# Altium schematic sheet current sink.SchDoc
size 566 x 495 mm; SheetNumber: 1; SheetTotal: 1
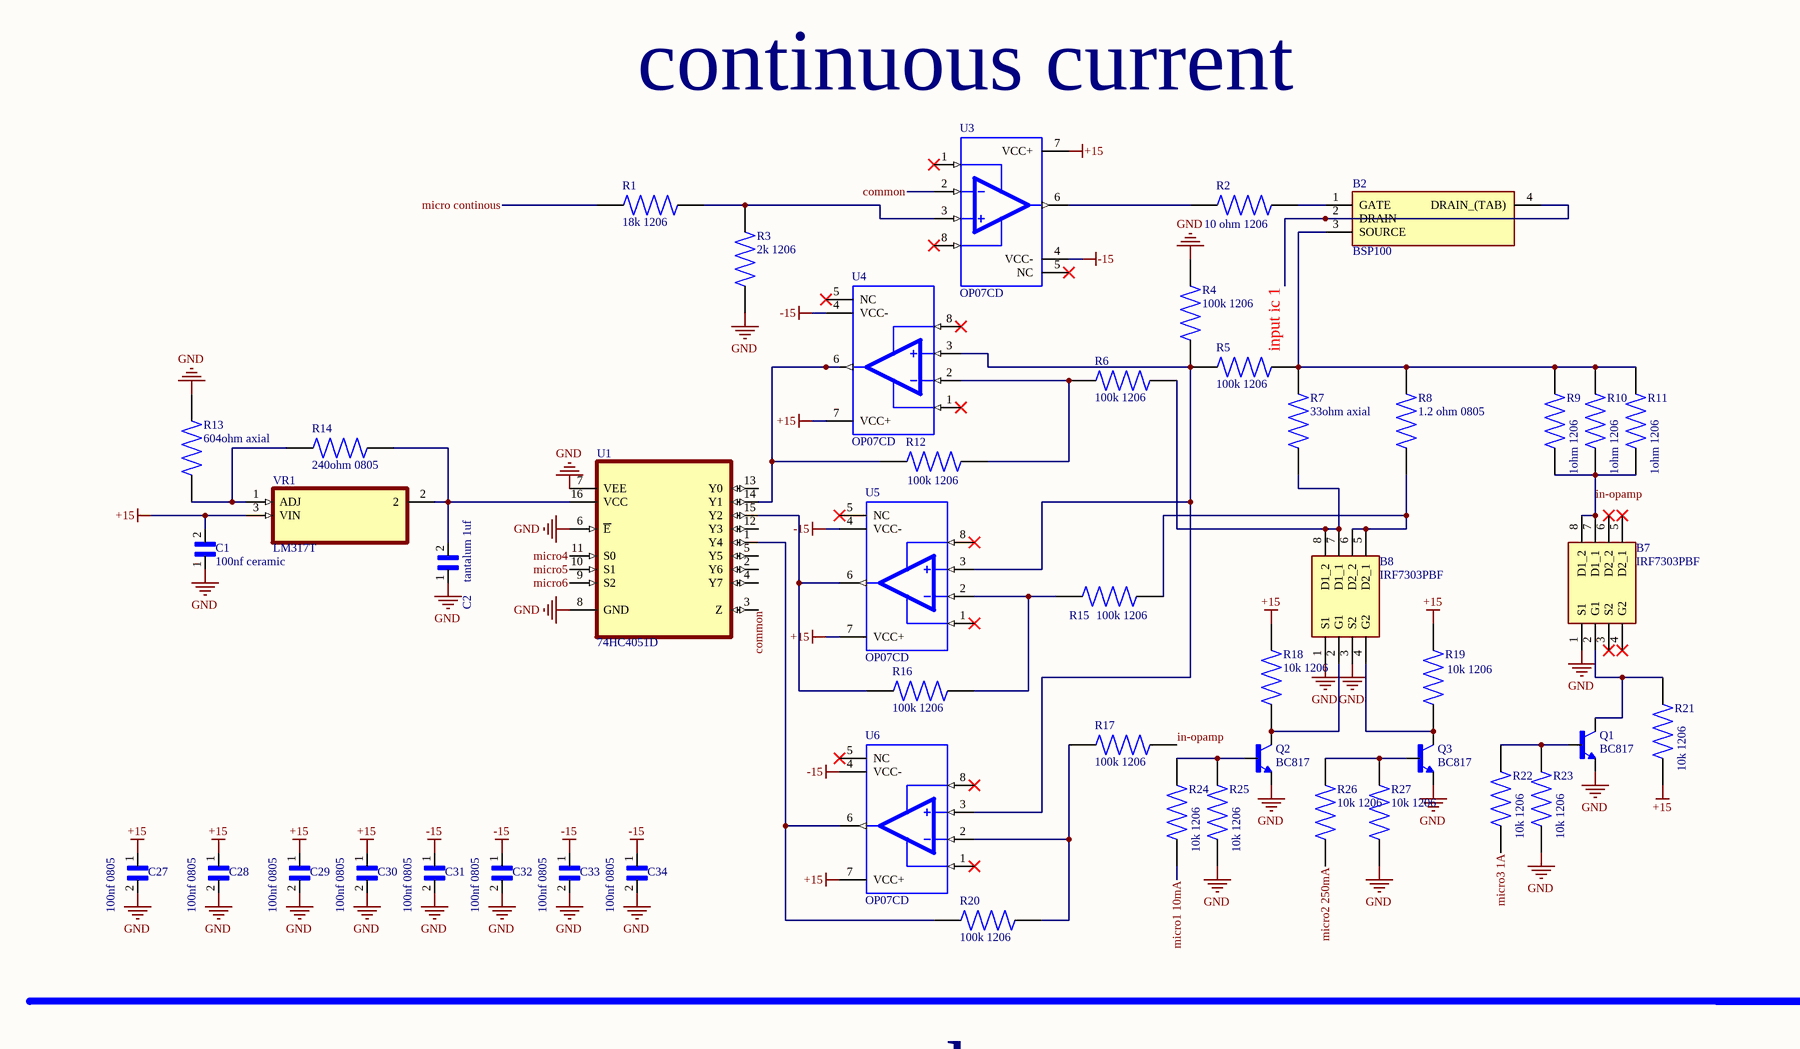
[diagram p0: current sink.SchDoc, top left]
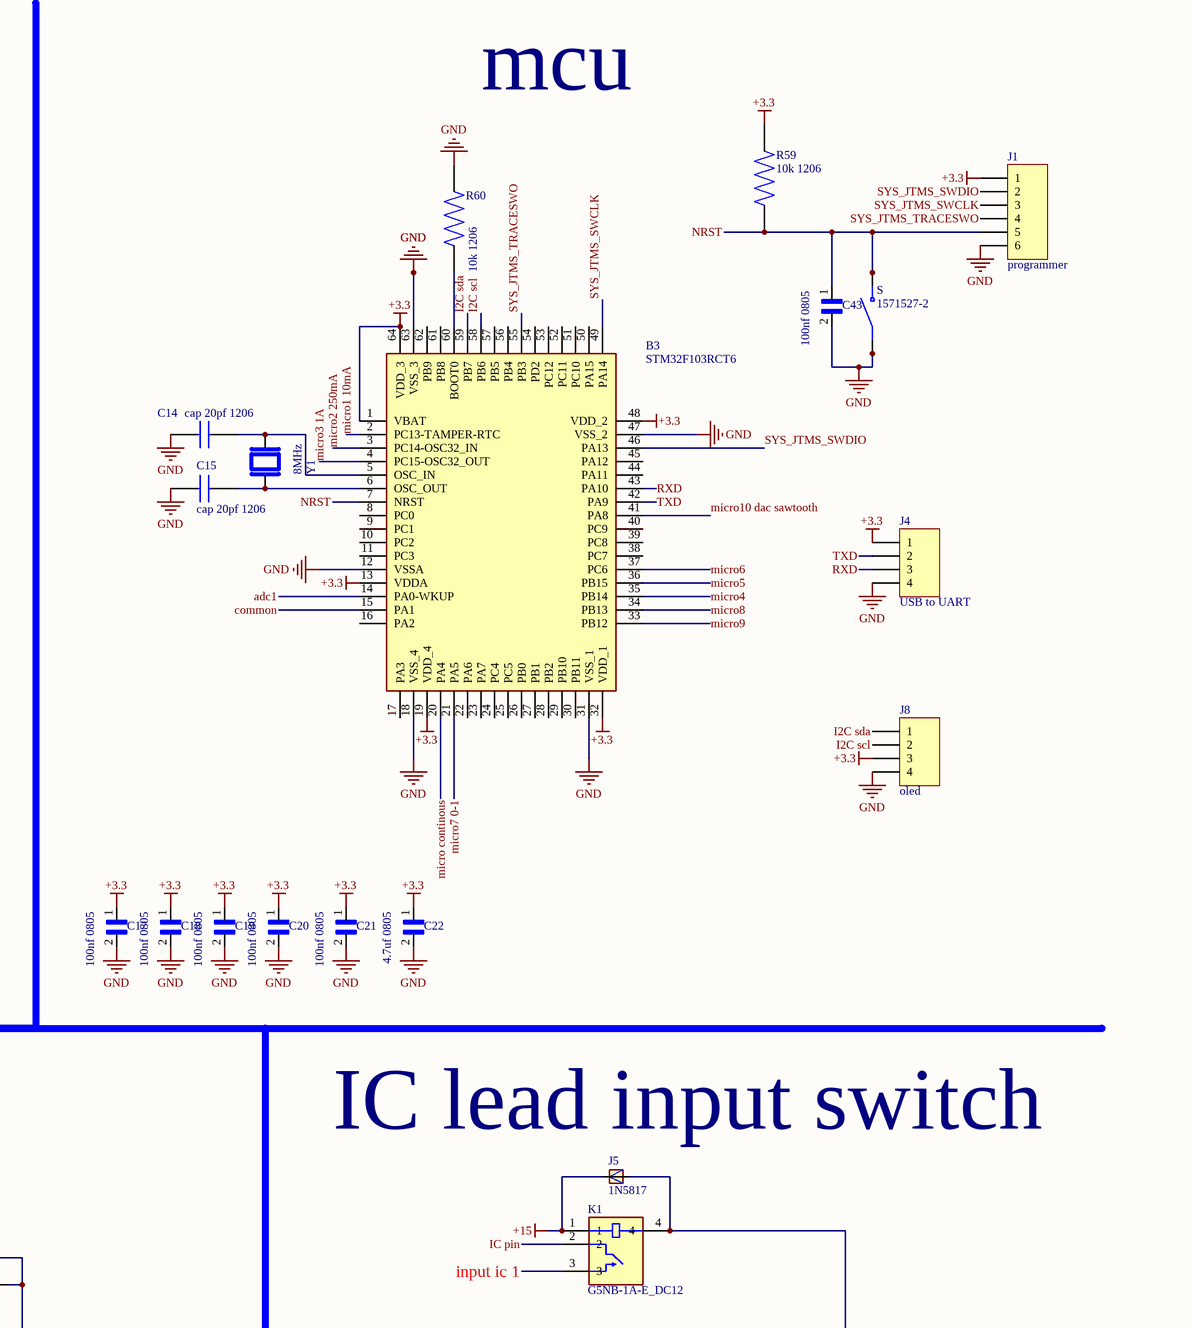
[diagram p1: current sink.SchDoc, top right]
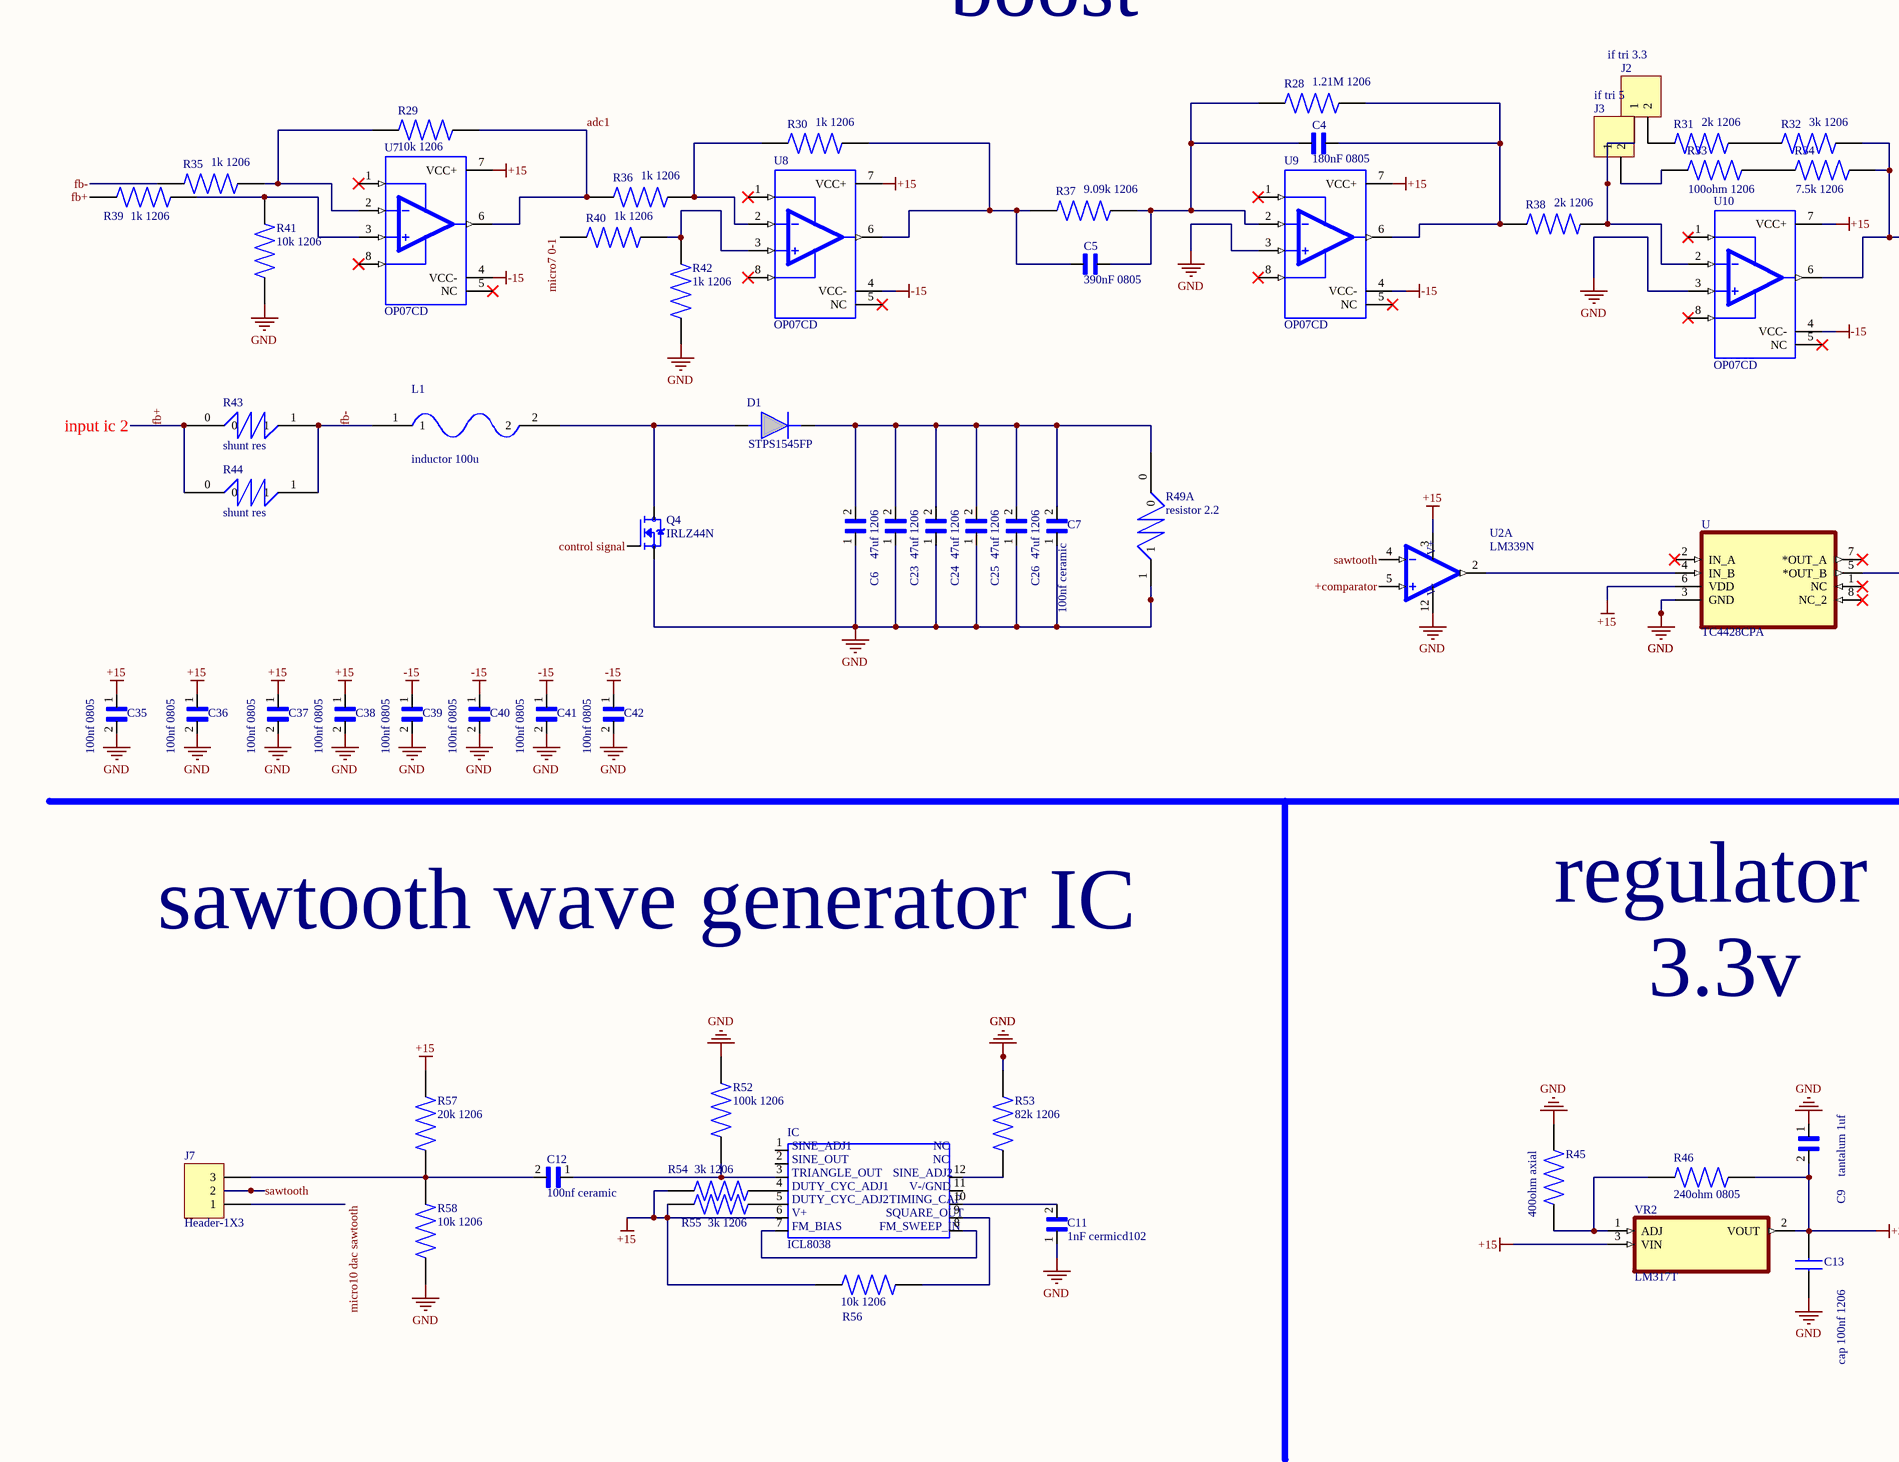
[diagram p2: current sink.SchDoc, bottom left]
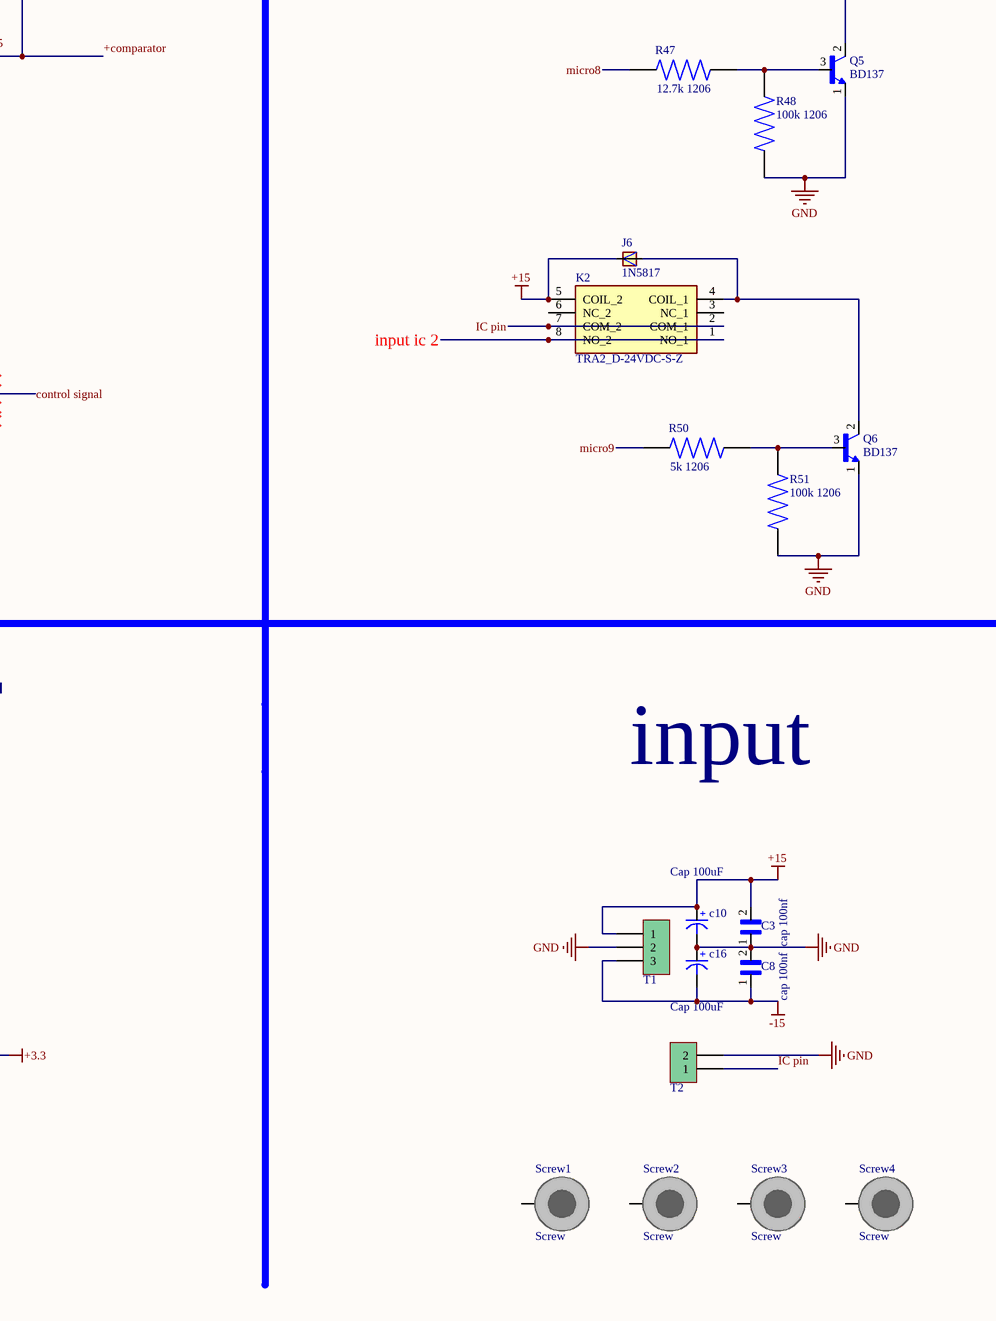
[diagram p3: current sink.SchDoc, bottom right]

## Parts
B2  BSP100  [SOT230P700X180-4N]
B3  STM32F103RCT6  [QFP50P1200X1200X160-64N]
B7  IRF7303PBF  [SOIC127P600X175-8N]
B8  IRF7303PBF  [SOIC127P600X175-8N]
C1  100nf ceramic  [CAPRB500W50L450T300H550]
C2  tantalum 1uf  [CAPC2012X140N]
C3  cap 100nf  [CAPC3216X170N]
C4  180nF 0805  [CAPC2012X145N]
C5  390nF 0805  [CAPC2012X145N]
C6  47uf 1206  [CAPC3216X180N]
C7  100nf ceramic  [CAPRB500W50L450T300H550]
C8  cap 100nf  [CAPC3216X170N]
C9  tantalum 1uf  [CAPC2012X140N]
c10  Cap 100uF  [Cap 100uF]
C11  1nF cermicd102  [CAPRB250W50L400T250H550]
C12  100nf ceramic  [CAPRB500W50L450T300H550]
C13  cap 100nf 1206  [CAPC3216X170N]
C14  cap 20pf 1206  [CAPC3216X170N]
C15  cap 20pf 1206  [CAPC3216X170N]
c16  Cap 100uF  [Cap 100uF]
C17  100nf 0805  [CAPC2012X145N]
C18  100nf 0805  [CAPC2012X145N]
C19  100nf 0805  [CAPC2012X145N]
C20  100nf 0805  [CAPC2012X145N]
C21  100nf 0805  [CAPC2012X145N]
C22  4.7uf 0805  [CAPC2012X145N]
C23  47uf 1206  [CAPC3216X180N]
C24  47uf 1206  [CAPC3216X180N]
C25  47uf 1206  [CAPC3216X180N]
C26  47uf 1206  [CAPC3216X180N]
C27  100nf 0805  [CAPC2012X145N]
C28  100nf 0805  [CAPC2012X145N]
C29  100nf 0805  [CAPC2012X145N]
C30  100nf 0805  [CAPC2012X145N]
C31  100nf 0805  [CAPC2012X145N]
C32  100nf 0805  [CAPC2012X145N]
C33  100nf 0805  [CAPC2012X145N]
C34  100nf 0805  [CAPC2012X145N]
C35  100nf 0805  [CAPC2012X145N]
C36  100nf 0805  [CAPC2012X145N]
C37  100nf 0805  [CAPC2012X145N]
C38  100nf 0805  [CAPC2012X145N]
C39  100nf 0805  [CAPC2012X145N]
C40  100nf 0805  [CAPC2012X145N]
C41  100nf 0805  [CAPC2012X145N]
C42  100nf 0805  [CAPC2012X145N]
C43  100nf 0805  [CAPC2012X145N]
D1  STPS1545FP  [TO508P460X1020X2030-2P]
IC  ICL8038  [ICL8038]
J1  programmer  [Header-1X7]
J2  if tri 3.3  [Header-1X2]
J3  if tri 5  [Header-1X2]
J4  USB to UART  [Header-1X4]
J5  1N5817  [DO41-10]
J6  1N5817  [DO41-10]
J7  Header-1X3  [Header-1X3]
J8  oled  [Header-1X4]
K1  G5NB-1A-E_DC12  [RELAY_G5NB-1A_DC5_OMR]
K2  TRA2_D-24VDC-S-Z  [TRA2D24VDCSZ]
L1  inductor 100u  [inductor]
Q1  BC817  [SOT95P230X110-3N]
Q2  BC817  [SOT95P230X110-3N]
Q3  BC817  [SOT95P230X110-3N]
Q4  IRLZ44N  [TO254P1054X469X1930-3]
Q5  BD137  [TO229P300X760X1237-3P]
Q6  BD137  [TO229P300X760X1237-3P]
R1  18k 1206  [RES_ERJU08J274V]
R2  10 ohm 1206  [RES_ERJU08J274V]
R3  2k 1206  [RES_ERJU08J274V]
R4  100k 1206  [RES_ERJU08J274V]
R5  100k 1206  [RES_ERJU08J274V]
R6  100k 1206  [RES_ERJU08J274V]
R7  33ohm axial  [RESAD1081W64L635D269]
R8  1.2 ohm 0805  [RESC2012X60N]
R9  1ohm 1206  [RES_ERJU08J274V]
R10  1ohm 1206  [RES_ERJU08J274V]
R11  1ohm 1206  [RES_ERJU08J274V]
R12  100k 1206  [RES_ERJU08J274V]
R13  604ohm axial  [RESAD1081W64L635D269]
R14  240ohm 0805  [RESC2012X60N]
R15  100k 1206  [RES_ERJU08J274V]
R16  100k 1206  [RES_ERJU08J274V]
R17  100k 1206  [RES_ERJU08J274V]
R18  10k 1206  [RES_ERJU08J274V]
R19  10k 1206  [RES_ERJU08J274V]
R20  100k 1206  [RES_ERJU08J274V]
R21  10k 1206  [RES_ERJU08J274V]
R22  10k 1206  [RES_ERJU08J274V]
R23  10k 1206  [RES_ERJU08J274V]
R24  10k 1206  [RES_ERJU08J274V]
R25  10k 1206  [RES_ERJU08J274V]
R26  10k 1206  [RES_ERJU08J274V]
R27  10k 1206  [RES_ERJU08J274V]
R28  1.21M 1206  [RES_ERJU08J274V]
R29  10k 1206  [RES_ERJU08J274V]
R30  1k 1206  [RES_ERJU08J274V]
R31  2k 1206  [RES_ERJU08J274V]
R32  3k 1206  [RES_ERJU08J274V]
R33  100ohm 1206  [RES_ERJU08J274V]
R34  7.5k 1206  [RES_ERJU08J274V]
R35  1k 1206  [RES_ERJU08J274V]
R36  1k 1206  [RES_ERJU08J274V]
R37  9.09k 1206  [RES_ERJU08J274V]
R38  2k 1206  [RES_ERJU08J274V]
R39  1k 1206  [RES_ERJU08J274V]
R40  1k 1206  [RES_ERJU08J274V]
R41  10k 1206  [RES_ERJU08J274V]
R42  1k 1206  [RES_ERJU08J274V]
R43  shunt res  [shunt]
R44  shunt res  [shunt]
R45  400ohm axial  [RESAD1081W64L635D269]
R46  240ohm 0805  [RESC2012X60N]
R47  12.7k 1206  [RES_ERJU08J274V]
R48  100k 1206  [RES_ERJU08J274V]
R49  resistor 2.2  [resssss]  (part A of 3)
R50  5k 1206  [RES_ERJU08J274V]
R51  100k 1206  [RES_ERJU08J274V]
R52  100k 1206  [RES_ERJU08J274V]
R53  82k 1206  [RES_ERJU08J274V]
R54  3k 1206  [RES_ERJU08J274V]
R55  3k 1206  [RES_ERJU08J274V]
R56  10k 1206  [RES_ERJU08J274V]
R57  20k 1206  [RES_ERJU08J274V]
R58  10k 1206  [RES_ERJU08J274V]
R59  10k 1206  [RES_ERJU08J274V]
R60  10k 1206  [RES_ERJU08J274V]
S  1571527-2  [SW_1571527-2]
Screw1  Screw  [Screw]
Screw2  Screw  [Screw]
Screw3  Screw  [Screw]
Screw4  Screw  [Screw]
T1  Phoenix terminal  [phoenix terminal 3]  (value not drawn)
T2  Phoenix terminal  [phoenix terminal 2]  (value not drawn)
U  TC4428CPA  [DIP254P762X432-8]
U1  74HC4051D  [SOIC127P600X175-16N]
U2  LM339N  [DIP794W45P254L1918H533Q14]  (part A of 4)
U3  OP07CD  [SOIC127P599X175-8N]
U4  OP07CD  [SOIC127P599X175-8N]
U5  OP07CD  [SOIC127P599X175-8N]
U6  OP07CD  [SOIC127P599X175-8N]
U7  OP07CD  [SOIC127P599X175-8N]
U8  OP07CD  [SOIC127P599X175-8N]
U9  OP07CD  [SOIC127P599X175-8N]
U10  OP07CD  [SOIC127P599X175-8N]
VR1  LM317T  [TO254P1054X470X1955-3]
VR2  LM317T  [TO254P1054X470X1955-3]
Y1  8MHz  [XTAL_HC49P488W43L1085T450H368]

## Nets
+3.3: B3.1(VBAT) B3.13(VDDA) B3.19(VDD_4) B3.32(VDD_1) B3.48(VDD_2) B3.64(VDD_3) C9.2 C13.2 C17.1 C18.1 C19.1 C20.1 C21.1 C22.1 J1.1 J4.1 J8.3 R46.2 R59.2 VR2.2(VOUT)
+15: C1.2 C3.2 c10.1(+) C27.1 C28.1 C29.1 C30.1 C35.1 C36.1 C37.1 C38.1 IC.6 J5.C J6.C K1.1 K2.5(COIL_2) R18.2 R19.2 R21.2 R54.1 R55.1 R56.1 R57.2 T1.1 U.6(VDD) U2.3(VCC) U3.7(VCC+) U4.7(VCC+) U5.7(VCC+) U6.7(VCC+) U7.7(VCC+) U8.7(VCC+) U9.7(VCC+) U10.7(VCC+) VR1.3(VIN) VR2.3(VIN)
-15: C8.1 c16.2(-) C31.1 C32.1 C33.1 C34.1 C39.1 C40.1 C41.1 C42.1 T1.3 U3.4(VCC-) U4.4(VCC-) U5.4(VCC-) U6.4(VCC-) U7.4(VCC-) U8.4(VCC-) U9.4(VCC-) U10.4(VCC-)
GND: B3.12(VSSA) B3.18(VSS_4) B3.31(VSS_1) B3.47(VSS_2) B3.63(VSS_3) B7.1(S1) B8.1(S1) B8.3(S2) C1.1 C2.1 C3.1 C6.1 C7.1 C8.2 C9.1 c10.2(-) C11.1 C13.1 C14.2 C15.2 c16.1(+) C17.2 C18.2 C19.2 C20.2 C21.2 C22.2 C23.1 C24.1 C25.1 C26.1 C27.2 C28.2 C29.2 C30.2 C31.2 C32.2 C33.2 C34.2 C35.2 C36.2 C37.2 C38.2 C39.2 C40.2 C41.2 C42.2 C43.2 J1.6 J4.4 J8.4 Q1.2(E) Q2.2(E) Q3.2(E) Q4.3(S) Q5.1(E) Q6.1(E) R3.1 R4.2 R13.2 R23.1 R25.1 R27.1 R41.1 R42.2 R45.2 R48.2 R49.1 R51.2 R52.1 R53.2 R58.1 R60.2 S.1(COM) S.2(COM) T1.2 T2.2 U.3(GND) U1.6(~{E}) U1.7(VEE) U1.8(GND) U2.12(GND) U9.3(IN+) U10.3(IN+)
+comparator: R32.1 R34.1 U2.5(IN1+) U10.6(OUT)
adc1: B3.14(PA0-WKUP) R29.2 R36.2 U7.6(OUT)
common: B3.15(PA1) U1.3(Z) U3.2(IN-)
control signal: Q4.1(G) U.5(*OUT_B)
fb+: K2.1(NO_1) K2.8(NO_2) R39.2 R43.0 R44.0  [also labelled input ic 2]
fb-: L1.1 R35.2 R43.1 R44.1
I2C scl: B3.58(PB6) J8.2
I2C sda: B3.59(PB7) J8.1
IC pin: K1.2 K2.2(COM_1) K2.7(COM_2) T2.1
in-opamp: B7.7(D1_1) B7.8(D1_2) R9.1 R10.1 R11.1 R17.1
input ic 1: B2.2(DRAIN) B2.4(DRAIN_(TAB)) K1.3
micro1 10mA: B3.2(PC13-TAMPER-RTC) R24.1
micro2 250mA: B3.3(PC14-OSC32_IN) R26.2
micro3 1A: B3.4(PC15-OSC32_OUT) R22.2
micro4: B3.35(PB14) U1.11(S0)
micro5: B3.36(PB15) U1.10(S1)
micro6: B3.37(PC6) U1.9(S2)
micro7 0-1: B3.21(PA5) R40.2
micro8: B3.34(PB13) R47.2
micro9: B3.33(PB12) R50.2
micro10 dac sawtooth: B3.41(PA8) J7.1
micro continous: B3.20(PA4) R1.1
NRST: B3.7(NRST) C43.1 J1.5 R59.1 S.3(NO) S.4(NO)
RXD: B3.43(PA10) J4.3
sawtooth: J7.2 U2.4(IN1-)
SYS_JTMS_SWCLK: B3.49(PA14) J1.3
SYS_JTMS_SWDIO: B3.46(PA13) J1.2
SYS_JTMS_TRACESWO: B3.55(PB3) J1.4
TXD: B3.42(PA9) J4.2
NetB2_1: B2.1(GATE) R2.2
NetB2_3: B2.3(SOURCE) R5.1 R7.2 R8.2 R9.2 R10.2 R11.2
NetB3_5: B3.5(OSC_IN) C14.1 Y1.2
NetB3_6: B3.6(OSC_OUT) C15.1 Y1.1
NetB3_60: B3.60(BOOT0) R60.1
NetB7_2: B7.2(G1) Q1.3(C) R21.1
NetB8_2: B8.2(G1) Q2.3(C) R18.1
NetB8_4: B8.4(G2) Q3.3(C) R19.1
NetB8_5: B8.5(D2_1) B8.6(D2_2) R8.1 R15.1
NetB8_7: B8.7(D1_1) B8.8(D1_2) R6.1 R7.1
NetC2_2: C2.2 R14.2 U1.16(VCC) VR1.2
NetC4_1: C4.1 C5.2 R28.2 R37.1 U9.2(IN-)
NetC4_2: C4.2 R28.1 R38.2 U9.6(OUT)
NetC5_1: C5.1 R30.1 R37.2 U8.6(OUT)
NetC6_2: C6.2 C7.2 C23.2 C24.2 C25.2 C26.2 D1.1(K) R49.0
NetC11_2: C11.2 IC.10
NetC12_1: C12.1 IC.3 R52.2
NetC12_2: C12.2 J7.3 R57.1 R58.2
NetD1_2: D1.2(A) L1.2 Q4.2(D)
NetIC_4: IC.4 R54.2
NetIC_5: IC.5 R55.2
NetIC_7: IC.7 IC.8
NetIC_9: IC.9 R56.2
NetIC_12: IC.12 R53.1
NetJ2_1: J2.1 J3.1 R38.1 U10.2(IN-)
NetJ2_2: J2.2 R31.2
NetJ3_2: J3.2 R33.2
NetJ5_A: J5.A K1.4 Q5.2(C)
NetJ6_A: J6.A K2.4(COIL_1) Q6.2(C)
NetQ1_1: Q1.1(B) R22.1 R23.2
NetQ2_1: Q2.1(B) R24.2 R25.2
NetQ3_1: Q3.1(B) R26.1 R27.2
NetQ5_3: Q5.3(B) R47.1 R48.1
NetQ6_3: Q6.3(B) R50.1 R51.1
NetR1_2: R1.2 R3.2 U3.3(IN+)
NetR2_1: R2.1 U3.6(OUT)
NetR4_1: R4.1 R5.2 U4.3(IN+) U5.3(IN+) U6.3(IN+)
NetR6_2: R6.2 R12.1 U4.2(IN-)
NetR12_2: R12.2 U1.14(Y1) U4.6(OUT)
NetR13_1: R13.1 R14.1 VR1.1(ADJ)
NetR15_2: R15.2 R16.1 U5.2(IN-)
NetR16_2: R16.2 U1.15(Y2) U5.6(OUT)
NetR17_2: R17.2 R20.1 U6.2(IN-)
NetR20_2: R20.2 U1.1(Y4) U6.6(OUT)
NetR29_1: R29.1 R35.1 U7.2(IN-)
NetR30_2: R30.2 R36.1 U8.2(IN-)
NetR31_1: R31.1 R32.2
NetR33_1: R33.1 R34.2
NetR39_1: R39.1 R41.2 U7.3(IN+)
NetR40_1: R40.1 R42.1 U8.3(IN+)
NetR45_1: R45.1 R46.1 VR2.1(ADJ)
NetU_4: U.4(IN_B) U2.2(OUT1)

Not connected (* = marked no-connect by the designer): B3 8(PC0) 9(PC1) 10(PC2) 11(PC3) 16(PA2) 17(PA3) 22(PA6) 23(PA7) 24(PC4) 25(PC5) 26(PB0) 27(PB1) 28(PB2) 29(PB10) 30(PB11) 38(PC7) 39(PC8) 40(PC9) 44(PA11) 45(PA12) 50(PA15) 51(PC10) 52(PC11) 53(PC12) 54(PD2) 56(PB4) 57(PB5) 61(PB8) 62(PB9); B7 3(S2)* 4(G2)* 5(D2_1)* 6(D2_2)*; IC 1 2 11; K2 3(NC_1) 6(NC_2); Screw1 1; Screw2 1; Screw3 1; Screw4 1; U 1(NC)* 2(IN_A)* 7(*OUT_A)* 8(NC_2)*; U1 2(Y6) 4(Y7) 5(Y5) 12(Y3) 13(Y0); U3 1(OFFSET_N1)* 5(NC)* 8(OFFSET_N2)*; U4 1(OFFSET_N1)* 5(NC)* 8(OFFSET_N2)*; U5 1(OFFSET_N1)* 5(NC)* 8(OFFSET_N2)*; U6 1(OFFSET_N1)* 5(NC)* 8(OFFSET_N2)*; U7 1(OFFSET_N1)* 5(NC)* 8(OFFSET_N2)*; U8 1(OFFSET_N1)* 5(NC)* 8(OFFSET_N2)*; U9 1(OFFSET_N1)* 5(NC)* 8(OFFSET_N2)*; U10 1(OFFSET_N1)* 5(NC)* 8(OFFSET_N2)*

## Notes on the sheet
- (near U3) continuous current
- mcu
- boost
- (near J5) IC lead input switch
- sawtooth wave generator IC
- regulator
- input
- 3.3v
- (in symbol ICL8038) SINE_ADJ1; NC; SINE_OUT; TRIANGLE_OUT; SINE_ADJ2; DUTY_CYC_ADJ1; V-/GND; DUTY_CYC_ADJ2; TIMING_CAP; V+; SQUARE_OUT; FM_BIAS; FM_SWEEP_IN
- (in symbol LM339N, part A) V+; V-

## Library data of the parts
B2 = BSP100: BSP100, N-channel MOSFET Transistor 3.2 A 30 V, 4-Pin SC-73; Manufacturer_Name: Nexperia; Geometry.Height: 1.8mm; Manufacturer_Part_Number: BSP100; Mouser Part Number: N/A; Mouser Price/Stock: https://www.mouser.com/Search/Refine.aspx?Keyword=N%2FA; Arrow Part Number: *; Arrow Price/Stock: *; Datasheet Link: https://datasheet.datasheetarchive.com/originals/distributors/Datasheets-301/10655.pdf
B3 = STM32F103RCT6: STM32F103RCT6, 32 bit ARM Cortex M3 Microcontroller 72MHz 256 kB Flash, 48 kB RAM, USB CAN I2C 64-Pin LQFP; Manufacturer_Name: STMicroelectronics; Geometry.Height: 1.6mm; Manufacturer_Part_Number: STM32F103RCT6; Mouser Part Number: 511-STM32F103RCT6; Mouser Price/Stock: https://www.mouser.co.uk/ProductDetail/STMicroelectronics/STM32F103RCT6?qs=%252BB84zevwoRA6TYzZIgOIoA%3D%3D; Arrow Part Number: STM32F103RCT6; Arrow Price/Stock: https://www.arrow.com/en/products/stm32f103rct6/stmicroelectronics?region=nac; Datasheet Link: http://www.st.com/st-web-ui/static/active/en/resource/technical/document/datasheet/CD00191185.pdf
B7 B8 = IRF7303PBF: Infineon IRF7303PBF Dual N-channel MOSFET Transistor, 4.9 A, 30 V, 8-Pin SOIC; Geometry.Height: 1.75mm; Manufacturer_Name: Infineon; Manufacturer_Part_Number: IRF7303PBF; Mouser Part Number: 942-IRF7303PBF; Mouser Price/Stock: https://www.mouser.co.uk/ProductDetail/Infineon-IR/IRF7303PBF?qs=NFlznGuI711wOOS8SabOfA%3D%3D; Arrow Part Number: IRF7303PBF; Arrow Price/Stock: https://www.arrow.com/en/products/irf7303pbf/infineon-technologies-ag; Datasheet Link: https://componentsearchengine.com/Datasheets/2/IRF7303PBF.pdf
C1 C7 C12 = FG24X7R2E222KNT00: 2200 pF Â±10% 250V Ceramic Capacitor X7R Radial; MF: TDK; MP: FG24X7R2E222KNT00; SnapEDA_Link: https://www.snapeda.com/parts/FG24X7R2E222KNT00/TDK/view-part/?ref=snap; Availability: In Stock; Check_prices: https://www.snapeda.com/parts/FG24X7R2E222KNT00/TDK/view-part/?ref=eda; Package: Radial TDK; Price: None; Purchase-URL: https://pricing.snapeda.com/search/part/FG24X7R2E222KNT00/?ref=eda; Value: *
C2 C9 = TCJP105M025R0500: 1ÂµF Molded Tantalum Polymer Capacitor 25V 0805 _2012 Metric_ 500mOhm @ 100kHz; MF: AVX; MP: TCJP105M025R0500; Digi-Key_Purchase_URL: https://www.digikey.com/product-detail/en/avx-corporation/TCJP105M025R0500/478-8995-1-ND/4561861?utm_source=snapeda&utm_medium=aggregator&utm_campaign=symbol; SnapEDA_Link: https://www.snapeda.com/parts/TCJP105M025R0500/AVX%20/%20Kyocera/view-part/1681108/?ref=snap; Package: 0805 AVX; Value: *; Digi-Key_Part_Number: 478-8995-1-ND
C3 C8 = VJ1206A270FXCAP: Package: None; Price: None; Value: *; MP: VJ1206A270FXCAP; Availability: Unavailable
C4 C5 = VJ0805A150KXCAP: 15 pF Â±10% 200V Ceramic Capacitor C0G, NP0 0805 (2012 Metric); MF: Vishay Vitramon; SnapEDA_Link: https://www.snapeda.com/parts/VJ0805A150KXCAP/Vishay+Vitramon/view-part/?ref=snap; Package: 2012 Vishay Vitramon; Value: *; MP: VJ0805A150KXCAP; Check_prices: https://www.snapeda.com/parts/VJ0805A150KXCAP/Vishay+Vitramon/view-part/?ref=eda
C6 C23-C26 = GRM31C5C2A104JA01L: SMD Capacitor C0G(EIA) with Capacitance: 0.10uF Tol. 5%. Rated Voltage: 100Vdc; MF: Murata; MP: GRM31C5C2A104JA01L; DigiKey-Purchase-URL: https://snapeda.com/shop?store=DigiKey&id=4379036; Package: 3216 Murata; Price: None; Availability: Unavailable; Mouser-Purchase-URL: https://snapeda.com/shop?store=Mouser&id=4379036; Arrow_Electronics-Purchase-URL: https://snapeda.com/shop?store=Arrow+Electronics&id=4379036; SnapEDA_Link: https://www.snapeda.com/parts/GRM31C5C2A104JA01L/Murata/view-part/4379036/?ref=snap; Value: *
C11 = FK18C0G2A102JN020: Multilayer Ceramic Capacitors MLCC - Leaded MLCC,C0G,100V,1nF, 5%,2.5mm; MF: TDK; Purchase-URL: https://pricing.snapeda.com/search/part/FK18C0G2A102JN020/?ref=eda; Package: None; Value: *; Check_prices: https://www.snapeda.com/parts/FK18C0G2A102JN020/TDK/view-part/?ref=eda; SnapEDA_Link: https://www.snapeda.com/parts/FK18C0G2A102JN020/TDK/view-part/?ref=snap; Price: None; Availability: In Stock; MP: FK18C0G2A102JN020
C13-C15 = VJ1206Y104KXQPW1BC: Multilayer Ceramic Capacitors MLCC - SMD/SMT 1206 0.1uF 10volts X7R 10%; Manufacturer_Name: Vishay; Geometry.Height: 1.7mm; Manufacturer_Part_Number: VJ1206Y104KXQPW1BC; Mouser Part Number: 77-VJ1206Y104KXQPBC; Mouser Price/Stock: https://www.mouser.co.uk/ProductDetail/Vishay-Vitramon/VJ1206Y104KXQPW1BC?qs=2YUU0rNB2ureKkHl5gTRXQ%3D%3D; Arrow Part Number: *; Arrow Price/Stock: *; Datasheet Link: http://www.vishay.com/docs/45200/vjhirelseries.pdf
C17-C22 C27-C43 = VJ0805A560KXCAP: Package: None; Price: None; Value: *; MP: VJ0805A560KXCAP; Availability: Unavailable
D1 = STPS1545FP: STMicroelectronics STPS1545FP, Schottky Diode, 45V 15A, 2-Pin TO-220FPAC; Geometry.Height: 4.6mm; Manufacturer_Name: STMicroelectronics; Manufacturer_Part_Number: STPS1545FP; Mouser Part Number: 511-STPS1545FP; Mouser Price/Stock: https://www.mouser.co.uk/ProductDetail/STMicroelectronics/STPS1545FP?qs=NP3vpjCFX6hHd5n%2FoyDXRA%3D%3D; Arrow Part Number: STPS1545FP; Arrow Price/Stock: https://www.arrow.com/en/products/stps1545fp/stmicroelectronics?region=europe; Datasheet Link: http://uk.rs-online.com/web/p/products/8107336
IC = ICL8038: IC OSCILL GEN/VOLT CONTROL 14DIP; MF: Renesas Electronics; Value: *; Price: None; MP: ICL8038; Availability: Unavailable; SnapEDA_Link: https://www.snapeda.com/parts/ICL8038/Renesas%20Electronics%20America%20Inc./view-part/1764984/?ref=snap; Package: None
J1 = Header-1X6: Pin Header 1X6, Pitch=2.54mm
J2 J3 = Header-1X2: Pin Header 1X2, Pitch=2.54mm
J4 J8 = Header-1X4: Pin Header 1X4, Pitch=2.54mm
J5 J6 = 1N5817: Diode Schottky 20 V 1A Through Hole DO-41; MP: 1N5817-T; MF: Diodes Inc.; Value: *; SnapEDA_Link: https://www.snapeda.com/parts/1N5817-T/Diodes+Inc./view-part/?ref=snap; Purchase-URL: https://pricing.snapeda.com/search/part/1N5817-T/?ref=eda; Check_prices: https://www.snapeda.com/parts/1N5817-T/Diodes+Inc./view-part/?ref=eda; Availability: In Stock; Price: None; Package: DO-41 Diodes Inc.
J7 = Header-1X3: Pin Header 1X3, Pitch=2.54mm
K1 = G5NB-1A-E_DC12: Power PCB Relay, 3A/5A, SPST-NO, 12 VDC, G5NB Series | Omron Electronic Components G5NB-1A-E DC12; MF: Omron Electronics Inc-EMC Div; SnapEDA_Link: https://www.snapeda.com/parts/G5NB-1A-E%20DC12/Omron+Electronics+Inc-EMC+Div/view-part/?ref=snap; Package: None; Value: *; MP: G5NB-1A-E DC12; Check_prices: https://www.snapeda.com/parts/G5NB-1A-E%20DC12/Omron+Electronics+Inc-EMC+Div/view-part/?ref=eda
K2 = TRA2_D-24VDC-S-Z: RELAY 24V/DC 1CO TRA2L-24VDC-S-Z; Manufacturer_Name: TIANBO Electronics; Manufacturer_Part_Number: TRA2 D-24VDC-S-Z; Geometry.Height: 20.8mm; Mouser Part Number: *; Mouser Price/Stock: *; Arrow Part Number: *; Arrow Price/Stock: *; Datasheet Link: http://www.tianbo-relay.com/upload/2019062416545013.pdf
L1 R43 R44 = Component_1
Q1-Q3 = BC817: Bipolar (BJT) Transistor NPN 45V 500mA 100MHz 250mW Surface Mount TO-236AB; MF: Rectron; MP: BC817; Value: *; SnapEDA_Link: https://www.snapeda.com/parts/BC817/Rectron/view-part/?ref=snap; Availability: In Stock; Purchase-URL: https://pricing.snapeda.com/search/part/BC817/?ref=eda; Package: SOT-23-3 Rectron; Price: None; Check_prices: https://www.snapeda.com/parts/BC817/Rectron/view-part/?ref=eda
Q4 = IRLZ44N: N-Channel 55 V 47A (Tc) 3.8W (Ta), 110W (Tc) Surface Mount D2PAK; MF: Infineon / IR; Package: TO-220-3 Infineon / IR; Availability: Not in stock; Value: *; MP: IRLZ44N; Check_prices: https://www.snapeda.com/parts/IRLZ44N/Infineon/view-part/?ref=eda; Price: None; SnapEDA_Link: https://www.snapeda.com/parts/IRLZ44N/Infineon/view-part/?ref=snap
Q5 Q6 = BD137: Bipolar (BJT) Transistor NPN 60 V 1.5 A - 1.25 W Through Hole TO-126; MF: ON Semiconductor; Purchase-URL: https://pricing.snapeda.com/search/part/BD137/?ref=eda; SnapEDA_Link: https://www.snapeda.com/parts/BD137/Onsemi/view-part/?ref=snap; Package: TO-225-3 ON Semiconductor; MP: BD137; Price: None; Availability: In Stock; Check_prices: https://www.snapeda.com/parts/BD137/Onsemi/view-part/?ref=eda; Value: *
R1-R6 R9-R12 R15-R42 R47 R48 R50-R60 = ERJU08J274V: 1206 anti-sulfurated resistor 1206 Anti-Sulfurated; MF: Panasonic; MP: ERJ-U08J274V; SnapEDA_Link: https://www.snapeda.com/parts/ERJ-U08J274V/Panasonic/view-part/?ref=snap; Package: 3216-2 Panasonic; Value: *; Check_prices: https://www.snapeda.com/parts/ERJ-U08J274V/Panasonic/view-part/?ref=eda
R7 R13 R45 = RNC55J1001DRB14: RES 1K OHM 1/8W .5% AXIAL; MF: Vishay Dale; SnapEDA_Link: https://www.snapeda.com/parts/RNC55J1001DRB14/Dale/view-part/?ref=snap; Package: erc55 Vishay; Value: *; MP: RNC55J1001DRB14; Check_prices: https://www.snapeda.com/parts/RNC55J1001DRB14/Dale/view-part/?ref=eda
R8 R14 R46 = CR0805-JW-221ELF: 220 Ohms Â±5% 0.125W, 1/8W Chip Resistor 0805 (2012 Metric) Moisture Resistant Thick Film; MF: Bourns; Value: *; Check_prices: https://www.snapeda.com/parts/CR0805-JW-221ELF/Bourns/view-part/?ref=eda; MP: CR0805-JW-221ELF; Price: None; Package: 2012 Bourns; Availability: In Stock; SnapEDA_Link: https://www.snapeda.com/parts/CR0805-JW-221ELF/Bourns/view-part/?ref=snap; Purchase-URL: https://pricing.snapeda.com/search/part/CR0805-JW-221ELF/?ref=eda
S = 1571527-2: Switch Tactile OFF _ON_ SPST Round Button Gull Wing 0.05A 24VDC 0.98N SMD T/R; MF: TE Connectivity / AMP; EU_RoHS_Compliance: Compliant; Availability: Unavailable; SnapEDA_Link: https://www.snapeda.com/parts/1571527-2/TE%20Connectivity%20/%20AMP/view-part/491702/?ref=snap; MP: 1571527-2; Price: None; Package: SMD-6 Omron Electronics; Value: *
T1 = Phoenix terminal 3: Terminal 3 Pin; Designer: Seyed Mohsen Ghasemain; E-mail: picpars@gmail.com; ComponentLinkURL: www.picpars.com
T2 = Phoenix terminal 2: Terminal 2 Pin; Designer: Seyed Mohsen Ghasemain; E-mail: picpars@gmail.com; ComponentLinkURL: www.picpars.com
U = TC4428CPA: Low-Side Gate Driver IC Inverting, Non-Inverting 8-PDIP; MF: Microchip; Digi-Key_Part_Number: TC4428CPA-ND; Package: DIP-8 Microchip; SnapEDA_Link: https://www.snapeda.com/parts/TC4428CPA/Microchip/view-part/442163/?ref=snap; Value: *; MP: TC4428CPA
U1 = 74HC4051D: 1 Circuit IC Switch 8:1 130Ohm 16-SOIC; MF: Toshiba; Value: *; SnapEDA_Link: https://www.snapeda.com/parts/74HC4051D/Toshiba/view-part/?ref=snap; MP: 74HC4051D; Purchase-URL: https://pricing.snapeda.com/search/part/74HC4051D/?ref=eda; Check_prices: https://www.snapeda.com/parts/74HC4051D/Toshiba/view-part/?ref=eda; Availability: In Stock; Price: None; Package: SOIC-16 Toshiba
U2 = LM339N: Comparator General Purpose CMOS, DTL, ECL, MOS, Open-Collector, TTL 14-DIP; MF: ON Semiconductor; SnapEDA_Link: https://www.snapeda.com/parts/LM339N/Onsemi/view-part/?ref=snap; Package: PDIP-14 ON Semiconductor; Value: *; MP: LM339N; Check_prices: https://www.snapeda.com/parts/LM339N/Onsemi/view-part/?ref=eda
U3-U10 = OP07CD: Low-Offset voltage (0.25mV) single operational amplifier 8-SOIC 0 to 70; MF: Texas Instruments; Purchase-URL: https://pricing.snapeda.com/search/part/OP07CD/?ref=eda; Package: SOIC-8 Texas Instruments; SnapEDA_Link: https://www.snapeda.com/parts/OP07CD/Texas%20Instruments/view-part/516771/?ref=snap; Value: *; Price: None; MP: OP07CD; Availability: Unavailable
VR1 VR2 = LM317T: 1.5-A, 40-V, adjustable linear voltage regulator 3-TO-220; MF: Texas Instruments; SnapEDA_Link: https://www.snapeda.com/parts/LM317T/Texas+Instruments/view-part/?ref=snap; Package: TO-220-3 Texas Instruments; Value: *; MP: LM317T; Check_prices: https://www.snapeda.com/parts/LM317T/Texas+Instruments/view-part/?ref=eda
Y1 = ATS08A-E: 8MHz Â±30ppm Crystal 20pF 60 Ohms HC-49/US; MF: CTS-Frequency Controls; Price: None; Availability: Good; Package: HC-49/US CTS-Frequency Controls; Purchase-URL: https://pricing.snapeda.com/search/part/ATS08A-E/?ref=eda; SnapEDA_Link: https://www.snapeda.com/parts/ATS08A-E/CTS-Frequency%20Controls/view-part/2457201/?ref=snap; Value: *; MP: ATS08A-E; Check_prices: https://www.snapeda.com/parts/ATS08A-E/CTS-Frequency%20Controls/view-part/2457201/?ref=eda